# Altium project A00.IZDELIE.PrjPcb
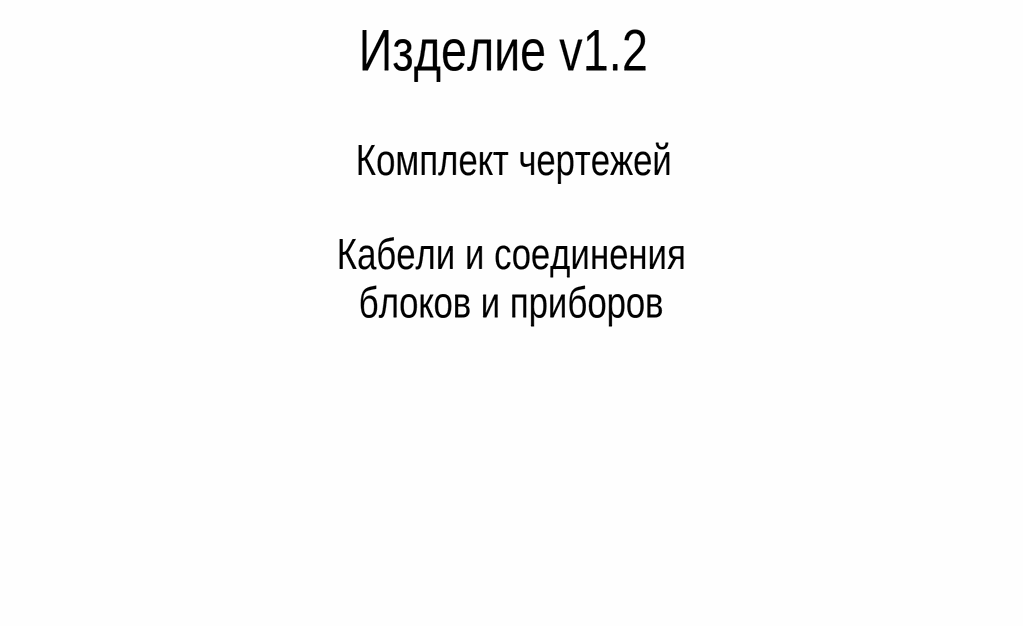
[diagram p0: 00.Izdelie.Title.SchDoc]
15 sheets, 185 parts. Net scope: global (net labels, ports and power ports of the same name join across sheets).
Sheets:
  00.Izdelie.Title.SchDoc
  01.Izdelie.Units.SchDoc
  02.C216. A01-A31,A32,A33,A34,A35,A36. Module BASU executive mechanisms.SchDoc
  02.C214. A01-A16, A17. Module BASU Stoper VN_HN.SchDoc
  02.C212. A01-A12. Module BASU Turret Horizontal aiming encoder .SchDoc
  02.C210. A01-A24. Module BASU Optics Vertical motor.SchDoc
  02.C208. A01-A22. Module BASU Optics Horizontal motor .SchDoc
  02.C207. A01-A21. Module BASU signals OPK.SchDoc
  02.C205. A01-A11. Module BASU Encoder for Horizontal motor.SchDoc
  02.C203. A01-A73. Module BASU AC power .SchDoc
  02.C108. A41-A72. Module AC220V.SchDoc
  02.C107. A41-A72. Module DC24V .SchDoc
  02.C105. A41-A02. Module Gyroscope.SchDoc
  02.C102. A41-A73. Module DC power.SchDoc
  02.C101. A41-A73. Module signals.SchDoc

## Sheet 00.Izdelie.Title.SchDoc
size 209 x 297 mm; Author: Мурашкин Д.В.; Address1: Address1; Address2: Address2; Address3: Address3; Address4: Address4; DocumentNumber: ИЗДЕЛИЕ-1-2; SheetNumber: 1; SheetTotal: 27; Scale: 1:1; Letter1Column: Э; PartName: Кабели

### Notes on the sheet
- Изделие v1.2
- Комплект чертежей
- Кабели и соединения
  блоков и приборов
- Перв. примен.
- Справ. №
- Подп. и дата
- Инв. № дубл.
- Взам. инв. №
- Разраб.
- Изм.
- Лист
- № докум.
- Подп.
- Дата
- Лит.
- Масса
- Масштаб
- Пров.
- Т.контр.
- Листов
- Инв. № подл.
- Утв.
- Н.контр.
- 2.106-A4
- Копировал
- Формат А4

## Sheet 01.Izdelie.Units.SchDoc: Электронные модули и кабели
size 209 x 297 mm; Author: Мурашкин Д.В.; Address1: Address1; Address2: Address2; Address3: Address3; Address4: Address4; DocumentNumber: ИЗДЕЛИЕ-1-2 Э6; SheetNumber: 2; Scale: 1:1; Letter1Column: Э6
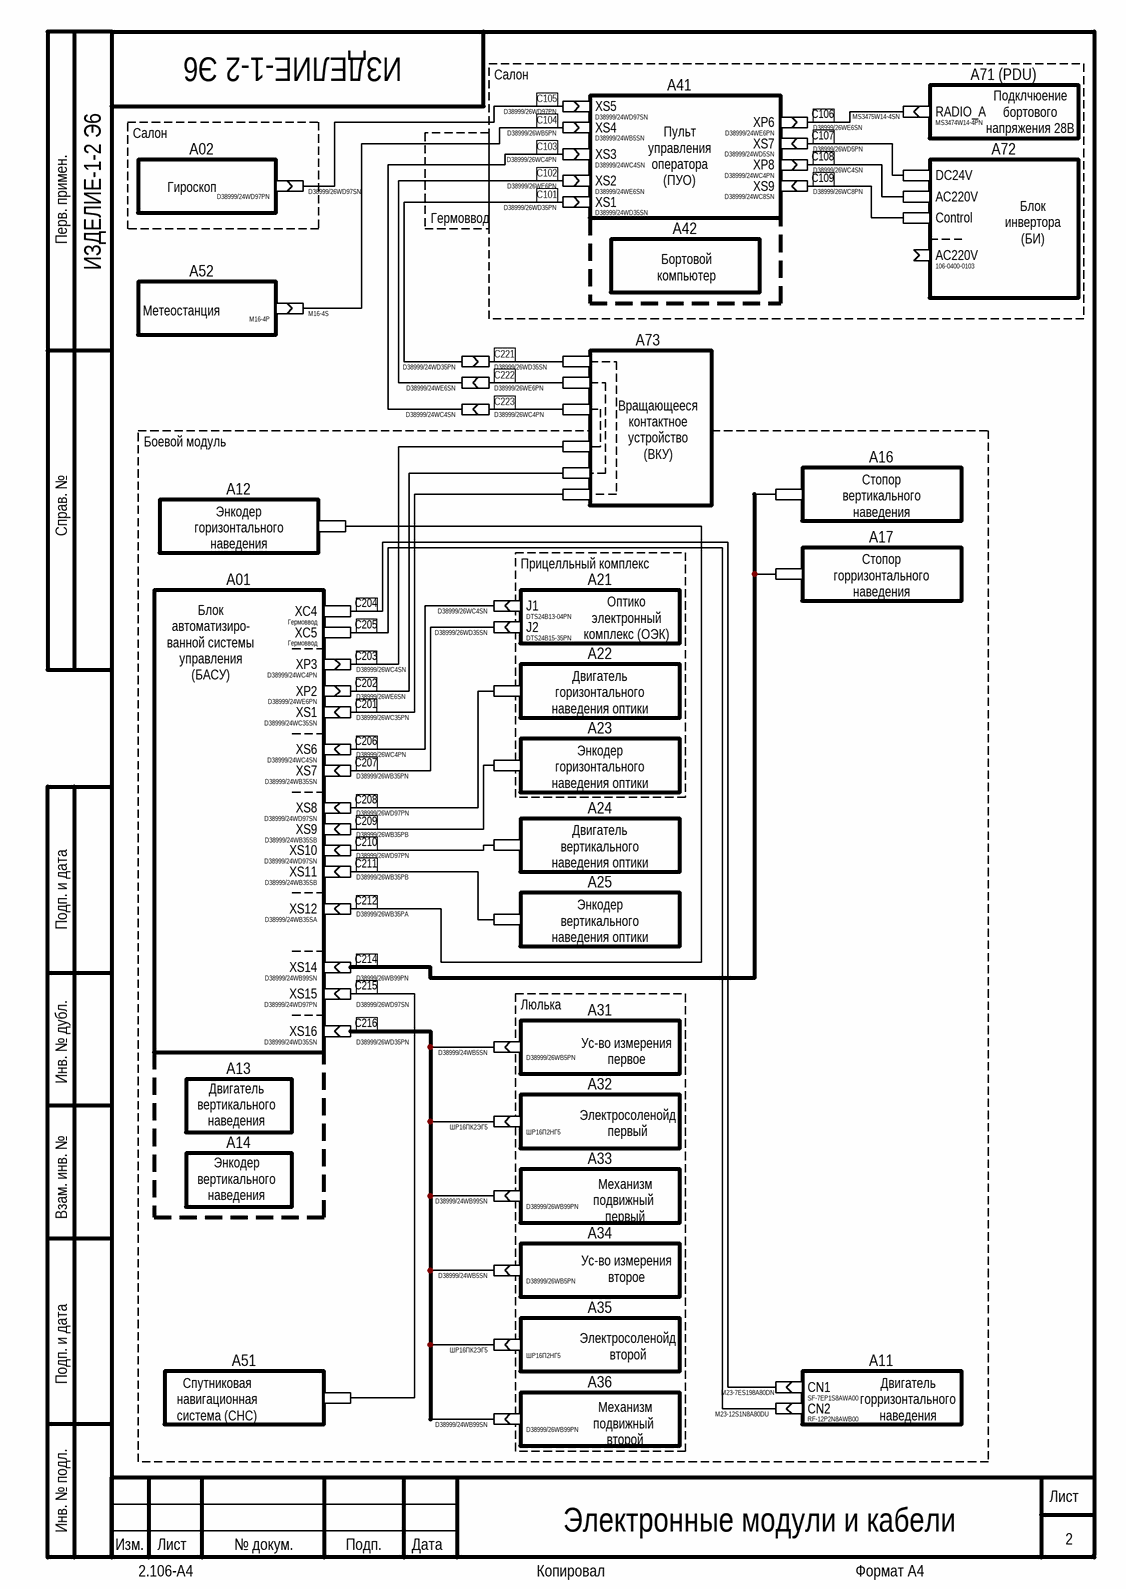
[diagram p1: 01.Izdelie.Units.SchDoc]

### Parts
(Parts that share a designator on the sheet are numbered #1, #2 ... from top to bottom, then left to right.)
A01.XP1  D38999/26WC35PN
A01.XP6  D38999/26WC4PN
A01.XP7  D38999/26WB35PN
A01.XP8  D38999/26WD97PN
A01.XP9  D38999/26WB35PB
A01.XP10  D38999/26WD97PN
A01.XP11  D38999/26WB35PB
A01.XP12  D38999/26WB35PA
A01.XP14  D38999/26WB99PN
A01.XP15  D38999/26WD97SN
A01.XP16  D38999/26WD35PN
A01.XS2  D38999/26WE6SN
A01.XS3  D38999/26WC4SN
A01.XS16.1  D38999/24WB5SN
A01.XS16.2  ШР16ПК2ЭГ5
A01.XS16.3  D38999/24WB99SN
A01.XS16.4  D38999/24WB5SN
A01.XS16.5  ШР16ПК2ЭГ5
A01.XS16.6  D38999/24WB99SN
A02.XP1  D38999/24WD97PN
A02.XS1  D38999/26WD97SN
A11.XS1  M23-7ES198A80DN  (no BOM)
A11.XS2  M23-12S1N8A80DU  (no BOM)
A12.XC1  Провод  (value not drawn)  (no BOM)
A16.XC1  Провод  (value not drawn)  (no BOM)
A17.XC1  Провод  (value not drawn)  (no BOM)
A21.XS1  D38999/26WC4SN
A21.XS2  D38999/26WD35SN
A22.XC1  Провод  (value not drawn)  (no BOM)
A23.XC1  Провод  (value not drawn)  (no BOM)
A24.XC1  Провод  (value not drawn)  (no BOM)
A25.XC1  Провод  (value not drawn)  (no BOM)
A31.XP1  D38999/26WB5PN
A32.XP1  ШР16П2НГ5  (no BOM)
A33.XP1  D38999/26WB99PN
A34.XP1  D38999/26WB5PN
A35.XP1  ШР16П2НГ5  (no BOM)
A36.XP1  D38999/26WB99PN
A41.XP1#1  D38999/26WD35PN
A41.XP2  D38999/26WE6PN
A41.XP3  D38999/26WC4PN
A41.XP4  D38999/26WB5PN
A41.XP5#1  D38999/26WD97PN
A41.XP7  D38999/26WD5PN
A41.XP9  D38999/26WC8PN
A41.XS6  D38999/26WE6SN
A41.XS8  D38999/26WC4SN
A51.XC1  (no value)  (no BOM)
A52.XP1  M16-4P  (no BOM)
A52.XS1  M16-4S  (no BOM)
A71.XS_RADIO_A  MS3475W14-4SN
A73.XC1  Провод  (value not drawn)  (no BOM)
A73.XC2  Провод  (value not drawn)  (no BOM)
A73.XC3#1  Провод  (value not drawn)  (no BOM)
A73.XC4  Провод  (value not drawn)  (no BOM)
A73.XC5  Провод  (value not drawn)  (no BOM)
A73.XC6  Провод  (value not drawn)  (no BOM)
A73.XP1#1  D38999/24WD35PN
A73.XP2#1  D38999/26WE6PN
A73.XP3  D38999/26WC4PN
A73.XS1#1  D38999/26WD35SN
A73.XS2#1  D38999/24WE6SN
A73.XS3  D38999/24WC4SN
AC220V#1  Провод  (value not drawn)  (no BOM)
AC220V#2  106-0400-0103
CN1  SF-7EP1S8AWA00  (no BOM)
CN2#1  RF-12P2N8AWB00  (no BOM)
Control  Провод  (value not drawn)  (no BOM)
DC24V  Провод  (value not drawn)  (no BOM)
J1  DTS24B13-04PN  (no BOM)
J2  DTS24B15-35PN  (no BOM)
RADIO_A  MS3474W14-4PN  (no BOM)
XC4  Гермоввод
XP2  D38999/24WE6PN
XP3  D38999/24WC4PN
XP6  D38999/24WE6PN
XP8  D38999/24WC4PN
XS1#1  D38999/24WD35SN
XS1#2  D38999/24WC35SN
XS2  D38999/24WE6SN
XS3  D38999/24WC4SN
XS4  D38999/24WB5SN
XS5  D38999/24WD97SN
XS6  D38999/24WC4SN
XS7#1  D38999/24WD5SN
XS7#2  D38999/24WB35SN
XS8  D38999/24WD97SN
XS9#1  D38999/24WC8SN
XS9#2  D38999/24WB35SB
XS10  D38999/24WD97SN
XS11  D38999/24WB35SB
XS12  D38999/24WB35SA
XS14  D38999/24WB99SN
XS15  D38999/24WD97PN
XS16  D38999/24WD35SN
XС5  Гермоввод

### Blocks framed on the sheet
A42: A41.XP1#1 A41.XP2-A41.XP4 A41.XP5#1 A41.XP7 A41.XP9 A41.XS6 A41.XS8 A71.XS_RADIO_A AC220V#1 Control DC24V XP6 XP8 XS7#1 XS9#1
A41: XS1#1 XS2-XS5
A71 (PDU): RADIO_A
A02: A02.XP1 A02.XS1
A72: AC220V#2
A21: J1 J2
A31: A31.XP1
A32: A32.XP1
A33: A33.XP1
A34: A34.XP1
A35: A35.XP1
A36: A36.XP1
A11: CN1 CN2#1

### Nets
С101: A41.XP1#1.0 A73.XP1#1.0
С102: A41.XP2.0 A73.XS2#1.0
С103: A41.XP3.0 A73.XS3.0
С104: A41.XP4.0 A52.XS1.0
С105: A02.XS1.0 A41.XP5#1.0
С106: A41.XS6.0 A71.XS_RADIO_A.0
С107: A41.XP7.0 DC24V.0
С108: A41.XS8.0 AC220V#1.0
С109: A41.XP9.0 Control.0
С201: A01.XP1.0 A73.XC6.0
С202: A01.XS2.0 A73.XC5.0
С203: A01.XS3.0 A73.XC4.0
С204: A11.XS1.0 XC4.1
С205: A11.XS2.0 XС5.1
С206: A01.XP6.0 A21.XS1.0
С207: A01.XP7.0 A21.XS2.0
С208: A01.XP8.0 A22.XC1.0
С209: A01.XP9.0 A23.XC1.0
С210: A01.XP10.0 A24.XC1.0
С211: A01.XP11.0 A25.XC1.0
С212: A01.XP12.0 A12.XC1.0
С214: A01.XP14.0 A16.XC1.0 A17.XC1.0
С215: A01.XP15.0 A51.XC1.0
С216: A01.XP16.0 A01.XS16.1.0 A01.XS16.2.0 A01.XS16.3.0 A01.XS16.4.0 A01.XS16.5.0 A01.XS16.6.0
С221: A73.XC1.0 A73.XS1#1.0
С222: A73.XC2.0 A73.XP2#1.0
С223: A73.XC3#1.0 A73.XP3.0

Not connected (* = marked no-connect by the designer): A02.XP1 0; A31.XP1 0; A32.XP1 0; A33.XP1 0; A34.XP1 0; A35.XP1 0; A36.XP1 0; A51.XC1 1; A52.XP1 0; AC220V#2 0; CN1 0; CN2#1 0; J1 0; J2 0; RADIO_A 0; XC4 0; XP2 0; XP3 0; XP6 0; XP8 0; XS1#1 0; XS1#2 0; XS2 0; XS3 0; XS4 0; XS5 0; XS6 0; XS7#1 0; XS7#2 0; XS8 0; XS9#1 0; XS9#2 0; XS10 0; XS11 0; XS12 0; XS14 0; XS15 0; XS16 0; XС5 0

### Notes on the sheet
- Салон
- (near A02.XP1) Гироскоп
- Пульт управления оператора (ПУО)
- Подклчюение бортового напряжения 28В
- Гермоввод
- Блок инвертора (БИ)
- Метеостанция
- A52
- Бортовой компьютер
- A73
- Боевой модуль
- Вращающееся контактное устройство (ВКУ)
- A16
- A12
- (near A16.XC1) Стопор вертикального наведения
- (near A12.XC1) Энкодер горизонтального наведения
- A01
- Прицелльный комплекс
- (near A17.XC1) Стопор горризонтального наведения
- A17
- Оптико электронный комплекс (ОЭК)
- A22
- Блок автоматизиро- ванной системы управления (БАСУ)
- (near A22.XC1) Двигатель горизонтального наведения оптики
- A23
- (near A23.XC1) Энкодер горизонтального наведения оптики
- (near A24.XC1) Двигатель вертикального наведения оптики
- A24
- A25
- (near A25.XC1) Энкодер вертикального наведения оптики
- Люлька
- Ус-во измерения первое
- Двигатель вертикального наведения
- A13
- Электросоленойд первый
- Энкодер вертикального наведения
- A14
- Механизм подвижный
  первый
- Ус-во измерения второе
- A51
- Электросоленойд второй
- (near A51.XC1) Спутниковая навигационная система (СНС)
- Механизм подвижный
  второй
- Двигатель горризонтального наведения
- Перв. примен.
- Справ. №
- Подп. и дата
- Инв. № дубл.
- Взам. инв. №
- Инв. № подл.
- Изм.
- Лист
- № докум.
- Подп.
- Дата
- 2.106-A4
- Копировал
- Формат А4

### Library data of the parts
A01.XP1 A01.XP6-A01.XP12 A01.XP14-A01.XP16 A02.XP1 A31.XP1 A32.XP1 A33.XP1 A34.XP1 A35.XP1 A36.XP1 A41.XP1#1 A41.XP2-A41.XP4 A41.XP5#1 A41.XP7 A41.XP9 A52.XP1 A73.XP1#1 A73.XP2#1 A73.XP3 J1 J2 RADIO_A XP2 XP3 XP6 XP8 = Connector cable plug: Operating temperature: -°C +°C; Dimension: .0mm x .0mm; Height: .0mm
  A01.XP1: Part name: D38999/26WC35PN; Mounting type: Surface mount
  A01.XP6 A41.XP3 A73.XP3: Part name: D38999/26WC4PN; Mounting type: Surface mount
  A01.XP7: Part name: D38999/26WB35PN; Mounting type: Surface mount
  A01.XP8 A01.XP10 A41.XP5#1: Part name: D38999/26WD97PN; Mounting type: Surface mount
  A01.XP9 A01.XP11: Part name: D38999/26WB35PB; Mounting type: Surface mount
  A01.XP12: Part name: D38999/26WB35PA; Mounting type: Surface mount
  A01.XP14 A33.XP1 A36.XP1: Part name: D38999/26WB99PN; Mounting type: Surface mount
  A01.XP15: Part name: D38999/26WD97SN; Mounting type: Surface mount
  A01.XP16 A41.XP1#1: Part name: D38999/26WD35PN; Mounting type: Surface mount
  A02.XP1: Part name: D38999/24WD97PN; Mounting type: Surface mount
  A31.XP1 A34.XP1 A41.XP4: Part name: D38999/26WB5PN; Mounting type: Surface mount
  A32.XP1 A35.XP1: Part name: ШР16П2НГ5; Mounting type: Surface mount
  A41.XP2 A73.XP2#1: Part name: D38999/26WE6PN; Mounting type: Surface mount
  A41.XP7: Part name: D38999/26WD5PN; Mounting type: Surface mount
  A41.XP9: Part name: D38999/26WC8PN; Mounting type: Surface mount
  A52.XP1: Part name: M16-4P; Mounting type: Surface mount
  A73.XP1#1: Part name: D38999/24WD35PN; Mounting type: Surface mount
  J1: Part name: DTS24B13-04PN; Mounting type: Surface mount
  J2: Part name: DTS24B15-35PN; Mounting type: Surface mount
  RADIO_A: Part name: MS3474W14-4PN; Mounting type: Panel
  XP2 XP6: Part name: D38999/24WE6PN; Mounting type: Surface mount
  XP3 XP8: Part name: D38999/24WC4PN; Mounting type: Surface mount
A01.XS2 A01.XS3 A01.XS16.1-A01.XS16.6 A02.XS1 A21.XS1 A21.XS2 A41.XS6 A41.XS8 A52.XS1 A71.XS_RADIO_A A73.XS1#1 A73.XS2#1 A73.XS3 XS1#1 XS1#2 XS2-XS6 XS7#1 XS7#2 XS8 XS9#1 XS9#2 XS10-XS12 XS14-XS16 = Connector cable socket: Operating temperature: -°C +°C; Dimension: .0mm x .0mm; Height: .0mm
  A01.XS2 A41.XS6: Part name: D38999/26WE6SN; Mounting type: Surface mount
  A01.XS3 A21.XS1 A41.XS8: Part name: D38999/26WC4SN; Mounting type: Surface mount
  A01.XS16.1 A01.XS16.4 XS4: Part name: D38999/24WB5SN; Mounting type: Surface mount
  A01.XS16.2 A01.XS16.5: Part name: ШР16ПК2ЭГ5; Mounting type: Surface mount
  A01.XS16.3 A01.XS16.6 XS14: Part name: D38999/24WB99SN; Mounting type: Surface mount
  A02.XS1: Part name: D38999/26WD97SN; Mounting type: Surface mount
  A21.XS2 A73.XS1#1: Part name: D38999/26WD35SN; Mounting type: Surface mount
  A52.XS1: Part name: M16-4S; Mounting type: Surface mount
  A71.XS_RADIO_A: Part name: MS3475W14-4SN; Mounting type: Cable
  A73.XS2#1 XS2: Part name: D38999/24WE6SN; Mounting type: Surface mount
  A73.XS3 XS3 XS6: Part name: D38999/24WC4SN; Mounting type: Surface mount
  XS1#1 XS16: Part name: D38999/24WD35SN; Mounting type: Surface mount
  XS1#2: Part name: D38999/24WC35SN; Mounting type: Surface mount
  XS5 XS8 XS10: Part name: D38999/24WD97SN; Mounting type: Surface mount
  XS7#1: Part name: D38999/24WD5SN; Mounting type: Surface mount
  XS7#2: Part name: D38999/24WB35SN; Mounting type: Surface mount
  XS9#1: Part name: D38999/24WC8SN; Mounting type: Surface mount
  XS9#2 XS11: Part name: D38999/24WB35SB; Mounting type: Surface mount
  XS12: Part name: D38999/24WB35SA; Mounting type: Surface mount
  XS15: Part name: D38999/24WD97PN; Mounting type: Surface mount
A11.XS1 A11.XS2 = Connector cable socket: Manufacturer: Phoenix Contact; Operating temperature: -°C +°C; Mounting type: Cable mount; Dimension: .0mm x .0mm; Height: .0mm
  A11.XS1: Part name: M23-7ES198A80DN
  A11.XS2: Part name: M23-12S1N8A80DU
A12.XC1 A16.XC1 A17.XC1 A22.XC1 A23.XC1 A24.XC1 A25.XC1 A51.XC1 A73.XC1 A73.XC2 A73.XC3#1 A73.XC4-A73.XC6 AC220V#1 Control DC24V XC4 XС5 = Connector cable coupling: Operating temperature: -°C +°C; Mounting type: Surface mount; Dimension: .0mm x .0mm; Height: .0mm
AC220V#2 = Connector cable socket: Socet 220V 2Р+РЕ 1x16А; Manufacturer: LEZARD; Part name: 106-0400-0103; Operating temperature: -°C +°C; Mounting type: Wall mount; Dimension: .0mm x .0mm; Height: .0mm
CN1 CN2#1 = Connector cable plug: Manufacturer: Phoenix Contact; Operating temperature: -°C +°C; Mounting type: Panel mount; Dimension: .0mm x .0mm; Height: .0mm
  CN1: Part name: SF-7EP1S8AWA00
  CN2#1: Part name: RF-12P2N8AWB00

## Sheet 02.C216. A01-A31,A32,A33,A34,A35,A36. Module BASU executive mechanisms.SchDoc: Кабель исполнительных механизмов
size 209 x 297 mm; Author: Мурашкин Д.В.; Address1: Address1; Address2: Address2; Address3: Address3; Address4: Address4; DocumentNumber: ИЗДЕЛИЕ-1-2; SheetNumber: 27; Scale: 1:1; Letter1Column: Э
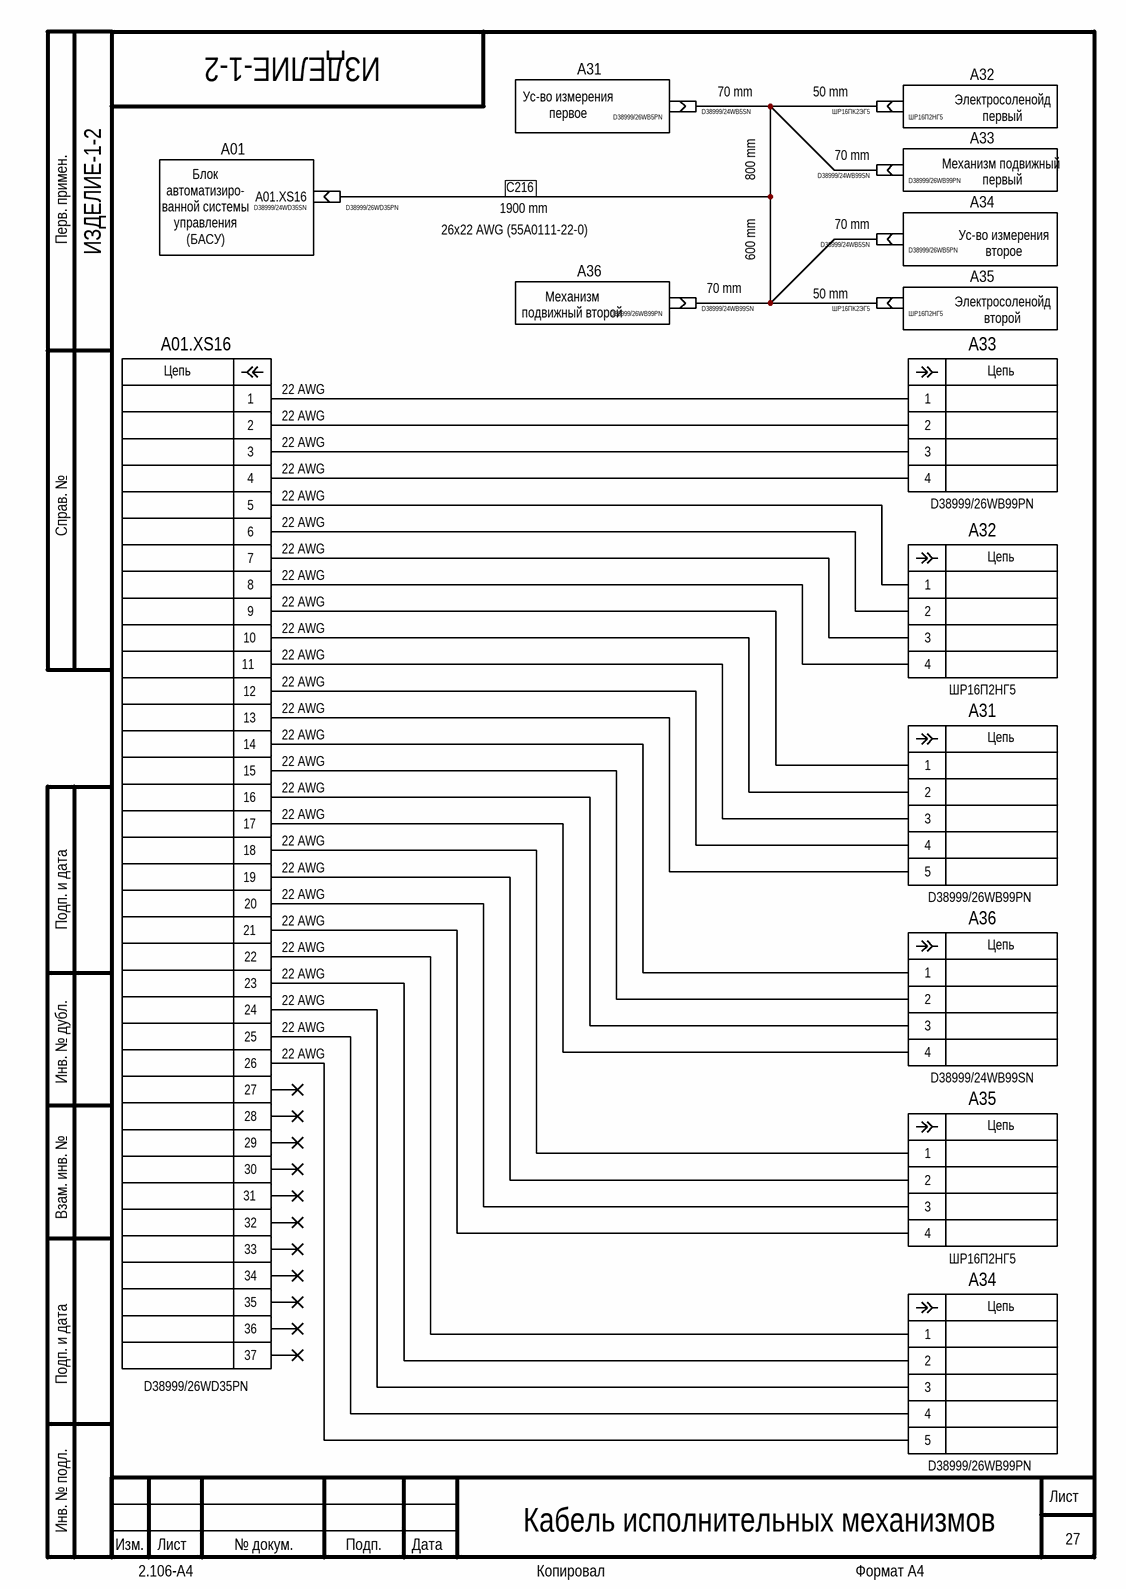
[diagram p2: 02.C216. A01-A31,A32,A33,A34,A35,A36. Module BASU executive mechanisms.SchDoc]

### Parts
(Parts that share a designator on the sheet are numbered #1, #2 ... from top to bottom, then left to right.)
A01.XS16#1  D38999/24WD35SN
A01.XS16#2  D38999/26WD35PN
A01.XS16#3  D38999/26WD35PN
A31  D38999/26WB99PN
A32  ШР16П2НГ5
A33  D38999/26WB99PN
A34  D38999/26WB99PN
A35  ШР16П2НГ5
A36  D38999/24WB99SN
A?#1  D38999/26WB5PN
A?#2  D38999/24WB5SN
A?#3  ШР16ПК2ЭГ5
A?#4  ШР16П2НГ5  (no BOM)
A?#5  D38999/24WB99SN
A?#6  D38999/26WB99PN
A?#7  D38999/24WB5SN
A?#8  D38999/26WB5PN
A?#9  D38999/26WB99PN
A?#10  D38999/24WB99SN
A?#11  ШР16ПК2ЭГ5
A?#12  ШР16П2НГ5  (no BOM)

### Blocks framed on the sheet
A32: A?#4
A33: A?#6
A34: A?#8
A35: A?#12

### Nets
С216: A01.XS16#2.0 A?#2.0 A?#3.0 A?#5.0 A?#7.0 A?#10.0 A?#11.0
NetA01.XS16#3_1: A01.XS16#3.1 A33.1
NetA01.XS16#3_2: A01.XS16#3.2 A33.2
NetA01.XS16#3_3: A01.XS16#3.3 A33.3
NetA01.XS16#3_4: A01.XS16#3.4 A33.4
NetA01.XS16#3_5: A01.XS16#3.5 A32.1
NetA01.XS16#3_6: A01.XS16#3.6 A32.2
NetA01.XS16#3_7: A01.XS16#3.7 A32.3
NetA01.XS16#3_8: A01.XS16#3.8 A32.4
NetA01.XS16#3_9: A01.XS16#3.9 A31.1
NetA01.XS16#3_10: A01.XS16#3.10 A31.2
NetA01.XS16#3_11: A01.XS16#3.11 A31.3
NetA01.XS16#3_12: A01.XS16#3.12 A31.4
NetA01.XS16#3_13: A01.XS16#3.13 A31.5
NetA01.XS16#3_14: A01.XS16#3.14 A36.1
NetA01.XS16#3_15: A01.XS16#3.15 A36.2
NetA01.XS16#3_16: A01.XS16#3.16 A36.3
NetA01.XS16#3_17: A01.XS16#3.17 A36.4
NetA01.XS16#3_18: A01.XS16#3.18 A35.1
NetA01.XS16#3_19: A01.XS16#3.19 A35.2
NetA01.XS16#3_20: A01.XS16#3.20 A35.3
NetA01.XS16#3_21: A01.XS16#3.21 A35.4
NetA01.XS16#3_22: A01.XS16#3.22 A34.1
NetA01.XS16#3_23: A01.XS16#3.23 A34.2
NetA01.XS16#3_24: A01.XS16#3.24 A34.3
NetA01.XS16#3_25: A01.XS16#3.25 A34.4
NetA01.XS16#3_26: A01.XS16#3.26 A34.5

Not connected (* = marked no-connect by the designer): A01.XS16#1 0; A01.XS16#3 27* 28* 29* 30* 31* 32* 33* 34* 35* 36* 37*; A?#1 0; A?#4 0; A?#6 0; A?#8 0; A?#9 0; A?#12 0

### Notes on the sheet
- (near A?#1) Ус-во измерения первое
- A31
- (near A?#2) 70 mm
- (near A?#3) 50 mm
- (near A?#4) Электросоленойд первый
- A01
- 800 mm
- (near A?#5) 70 mm
- (near A?#6) Механизм подвижный
  первый
- Блок автоматизиро- ванной системы управления (БАСУ)
- 26x22 AWG (55A0111-22-0)
- 1900 mm
- 600 mm
- (near A?#7) 70 mm
- (near A?#8) Ус-во измерения второе
- (near A?#9) Механизм подвижный второй
- A36
- (near A?#10) 70 mm
- (near A?#11) 50 mm
- (near A?#12) Электросоленойд второй
- (near A01.XS16#3) 22 AWG
- Перв. примен.
- Справ. №
- Подп. и дата
- Инв. № дубл.
- Взам. инв. №
- Инв. № подл.
- Изм.
- Лист
- № докум.
- Подп.
- Дата
- 2.106-A4
- Копировал
- Формат А4
- (in symbol Connector signal P5_1) Цепь
- (in symbol Connector signal P5_1_1_3) Цепь
- (in symbol Connector signal P37 MIL) Цепь

### Library data of the parts
A01.XS16#1 A?#2 A?#3 A?#5 A?#7 A?#10 A?#11 = Connector cable socket: Operating temperature: -°C +°C; Mounting type: Surface mount; Dimension: .0mm x .0mm; Height: .0mm
  A01.XS16#1: Part name: D38999/24WD35SN
  A?#2 A?#7: Part name: D38999/24WB5SN
  A?#3 A?#11: Part name: ШР16ПК2ЭГ5
  A?#5 A?#10: Part name: D38999/24WB99SN
A01.XS16#2 A?#1 A?#4 A?#6 A?#8 A?#9 A?#12 = Connector cable plug: Operating temperature: -°C +°C; Mounting type: Surface mount; Dimension: .0mm x .0mm; Height: .0mm
  A01.XS16#2: Part name: D38999/26WD35PN
  A?#1 A?#8: Part name: D38999/26WB5PN
  A?#4 A?#12: Part name: ШР16П2НГ5
  A?#6 A?#9: Part name: D38999/26WB99PN
A01.XS16#3 = Connector signal P37 MIL: P37 MIL; Operating temperature: -°C +°C; Mounting type: Surface mount; Dimension: .0mm x .0mm; Height: .0mm
A31 A34 = Connector signal P5_1: P5 MIL; Operating temperature: -°C +°C; Mounting type: Surface mount; Dimension: .0mm x .0mm; Height: .0mm
A32 A33 A35 A36 = Connector signal P5_1_1_3: P4 MIL_1; Operating temperature: -°C +°C; Mounting type: Surface mount; Dimension: .0mm x .0mm; Height: .0mm

## Sheet 02.C214. A01-A16, A17. Module BASU Stoper VN_HN.SchDoc: Кабель стопора
size 209 x 297 mm; Author: Мурашкин Д.В.; Address1: Address1; Address2: Address2; Address3: Address3; Address4: Address4; DocumentNumber: ИЗДЕЛИЕ-1-2; SheetNumber: 25; Scale: 1:1; Letter1Column: Э
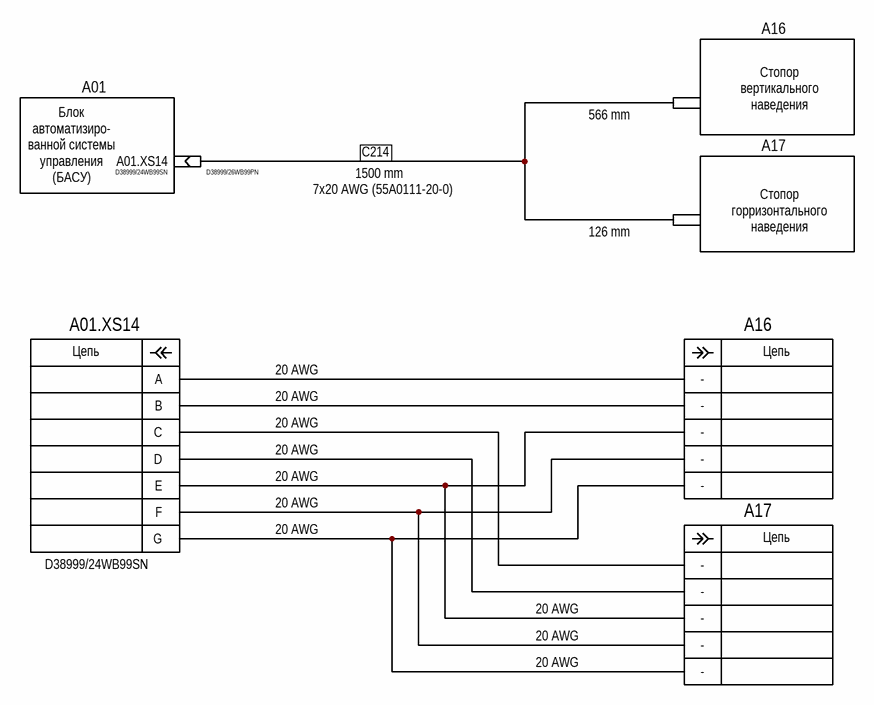
[diagram p3: 02.C214. A01-A16, A17. Module BASU Stoper VN_HN.SchDoc]

### Parts
(Parts that share a designator on the sheet are numbered #1, #2 ... from top to bottom, then left to right.)
A01.XS14#1  D38999/24WB99SN
A01.XS14#2  D38999/24WB99SN
A16  (no value)
A17  (no value)
A?#13  Провод  (value not drawn)  (no BOM)
A?#14  D38999/26WB99PN
A?#15  Провод  (value not drawn)  (no BOM)

### Nets
С214: A?#13.0 A?#14.0 A?#15.0
NetA01.XS14#2_A: A01.XS14#2.A A16.-
NetA01.XS14#2_B: A01.XS14#2.B A16.-
NetA01.XS14#2_C: A01.XS14#2.C A17.-
NetA01.XS14#2_D: A01.XS14#2.D A17.-
NetA01.XS14#2_E: A01.XS14#2.E A16.- A17.-
NetA01.XS14#2_F: A01.XS14#2.F A16.- A17.-
NetA01.XS14#2_G: A01.XS14#2.G A16.- A17.-

Not connected (* = marked no-connect by the designer): A01.XS14#1 0

### Notes on the sheet
- A01
- A16
- (near A?#13) 566 mm
- (near A?#13) Стопор вертикального наведения
- A17
- Блок автоматизиро- ванной системы управления (БАСУ)
- 7x20 AWG (55A0111-20-0)
- 1500 mm
- (near A?#15) 126 mm
- (near A?#15) Стопор горризонтального наведения
- 20 AWG
- Перв. примен.
- Справ. №
- Подп. и дата
- Инв. № дубл.
- Взам. инв. №
- Инв. № подл.
- Изм.
- Лист
- № докум.
- Подп.
- Дата
- 2.106-A4
- Копировал
- Формат А4
- (in symbol Connector signal P7) Цепь
- (in symbol P5 MIL _color) Цепь

### Library data of the parts
A01.XS14#1 = Connector cable socket: Part name: D38999/24WB99SN; Operating temperature: -°C +°C; Mounting type: Surface mount; Dimension: .0mm x .0mm; Height: .0mm
A01.XS14#2 = Connector signal P7: P7 MIL; Operating temperature: -°C +°C; Mounting type: Surface mount; Dimension: .0mm x .0mm; Height: .0mm
A16 A17 = P5 MIL _color: Operating temperature: -°C +°C; Mounting type: Surface mount; Dimension: .0mm x .0mm; Height: .0mm
A?#13 A?#15 = Connector cable coupling: Operating temperature: -°C +°C; Mounting type: Surface mount; Dimension: .0mm x .0mm; Height: .0mm
A?#14 = Connector cable plug: Part name: D38999/26WB99PN; Operating temperature: -°C +°C; Mounting type: Surface mount; Dimension: .0mm x .0mm; Height: .0mm

## Sheet 02.C212. A01-A12. Module BASU Turret Horizontal aiming encoder .SchDoc: Кабель энкодера ГН
size 209 x 297 mm; Author: Мурашкин Д.В.; Address1: Address1; Address2: Address2; Address3: Address3; Address4: Address4; DocumentNumber: ИЗДЕЛИЕ-1-2; SheetNumber: 24; Scale: 1:1; Letter1Column: Э
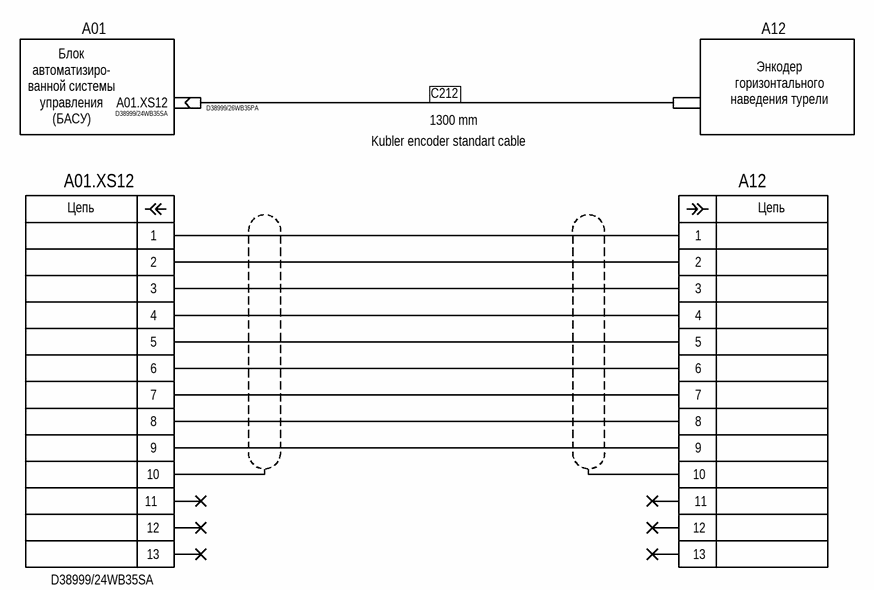
[diagram p4: 02.C212. A01-A12. Module BASU Turret Horizontal aiming encoder .SchDoc]

### Parts
(Parts that share a designator on the sheet are numbered #1, #2 ... from top to bottom, then left to right.)
A01.XS12#1  D38999/24WB35SA
A01.XS12#2  D38999/24WB35SA
A12  (no value)
A?#16  D38999/26WB35PA
A?#17  Провод  (value not drawn)  (no BOM)

### Nets
С212: A?#16.0 A?#17.0
NetA01.XS12#2_1: A01.XS12#2.1 A12.1
NetA01.XS12#2_2: A01.XS12#2.2 A12.2
NetA01.XS12#2_3: A01.XS12#2.3 A12.3
NetA01.XS12#2_4: A01.XS12#2.4 A12.4
NetA01.XS12#2_5: A01.XS12#2.5 A12.5
NetA01.XS12#2_6: A01.XS12#2.6 A12.6
NetA01.XS12#2_7: A01.XS12#2.7 A12.7
NetA01.XS12#2_8: A01.XS12#2.8 A12.8
NetA01.XS12#2_9: A01.XS12#2.9 A12.9

Not connected (* = marked no-connect by the designer): A01.XS12#1 0; A01.XS12#2 10 11* 12* 13*; A12 10 11* 12* 13*

### Notes on the sheet
- A01
- A12
- (near A?#17) Энкодер горизонтального наведения турели
- Блок автоматизиро- ванной системы управления (БАСУ)
- Kubler encoder standart cable
- 1300 mm
- Перв. примен.
- Справ. №
- Подп. и дата
- Инв. № дубл.
- Взам. инв. №
- Инв. № подл.
- Изм.
- Лист
- № докум.
- Подп.
- Дата
- 2.106-A4
- Копировал
- Формат А4
- (in symbol Connector signal P13) Цепь

### Library data of the parts
A01.XS12#1 = Connector cable socket: Part name: D38999/24WB35SA; Operating temperature: -°C +°C; Mounting type: Surface mount; Dimension: .0mm x .0mm; Height: .0mm
A01.XS12#2 A12 = Connector signal P13: P13 MIL; Operating temperature: -°C +°C; Mounting type: Surface mount; Dimension: .0mm x .0mm; Height: .0mm
A?#16 = Connector cable plug: Part name: D38999/26WB35PA; Operating temperature: -°C +°C; Mounting type: Surface mount; Dimension: .0mm x .0mm; Height: .0mm
A?#17 = Connector cable coupling: Operating temperature: -°C +°C; Mounting type: Surface mount; Dimension: .0mm x .0mm; Height: .0mm

## Sheet 02.C210. A01-A24. Module BASU Optics Vertical motor.SchDoc: Кабель двигателя ВН оптики
size 209 x 297 mm; Author: Мурашкин Д.В.; Address1: Address1; Address2: Address2; Address3: Address3; Address4: Address4; DocumentNumber: ИЗДЕЛИЕ-1-2; SheetNumber: 22; Scale: 1:1; Letter1Column: Э
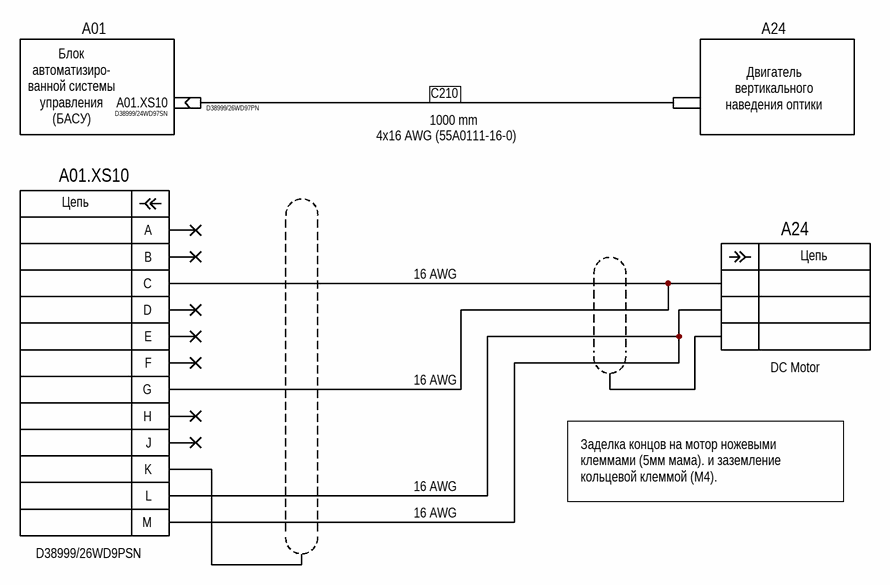
[diagram p5: 02.C210. A01-A24. Module BASU Optics Vertical motor.SchDoc]

### Parts
(Parts that share a designator on the sheet are numbered #1, #2 ... from top to bottom, then left to right.)
A01.XS10#1  D38999/24WD97SN
A01.XS10#2  D38999/26WD9PSN
A24  DC Motor
A?#18  D38999/26WD97PN
A?#19  Провод  (value not drawn)  (no BOM)

### Nets
С210: A?#18.0 A?#19.0
NetA01.XS10#2_C: A01.XS10#2.C A01.XS10#2.G A24.?2
NetA01.XS10#2_L: A01.XS10#2.L A01.XS10#2.M A24.?1

Not connected (* = marked no-connect by the designer): A01.XS10#1 0; A01.XS10#2 A* B* D* E* F* H* J* K; A24 ?3

### Notes on the sheet
- A01
- A24
- (near A?#19) Двигатель вертикального наведения оптики
- Блок автоматизиро- ванной системы управления (БАСУ)
- 4x16 AWG (55A0111-16-0)
- 1000 mm
- 16 AWG
- Заделка концов на мотор ножевыми клеммами (5мм мама). и заземление кольцевой клеммой (М4).
- Перв. примен.
- Справ. №
- Подп. и дата
- Инв. № дубл.
- Взам. инв. №
- Инв. № подл.
- Изм.
- Лист
- № докум.
- Подп.
- Дата
- 2.106-A4
- Копировал
- Формат А4
- (in symbol Connector signal P5_1_1_1) Цепь
- (in symbol Connector signal P12 MIL) Цепь

### Library data of the parts
A01.XS10#1 = Connector cable socket: Part name: D38999/24WD97SN; Operating temperature: -°C +°C; Mounting type: Surface mount; Dimension: .0mm x .0mm; Height: .0mm
A01.XS10#2 = Connector signal P12 MIL: P12 MIL; Operating temperature: -°C +°C; Mounting type: Surface mount; Dimension: .0mm x .0mm; Height: .0mm
A24 = Connector signal P5_1_1_1: Part name: DC Motor; Operating temperature: -°C +°C; Mounting type: Surface mount; Dimension: .0mm x .0mm; Height: .0mm
A?#18 = Connector cable plug: Part name: D38999/26WD97PN; Operating temperature: -°C +°C; Mounting type: Surface mount; Dimension: .0mm x .0mm; Height: .0mm
A?#19 = Connector cable coupling: Operating temperature: -°C +°C; Mounting type: Surface mount; Dimension: .0mm x .0mm; Height: .0mm

## Sheet 02.C208. A01-A22. Module BASU Optics Horizontal motor .SchDoc: Кабель двигателя ГН оптики
size 209 x 297 mm; Author: Мурашкин Д.В.; Address1: Address1; Address2: Address2; Address3: Address3; Address4: Address4; DocumentNumber: ИЗДЕЛИЕ-1-2; SheetNumber: 20; Scale: 1:1; Letter1Column: Э
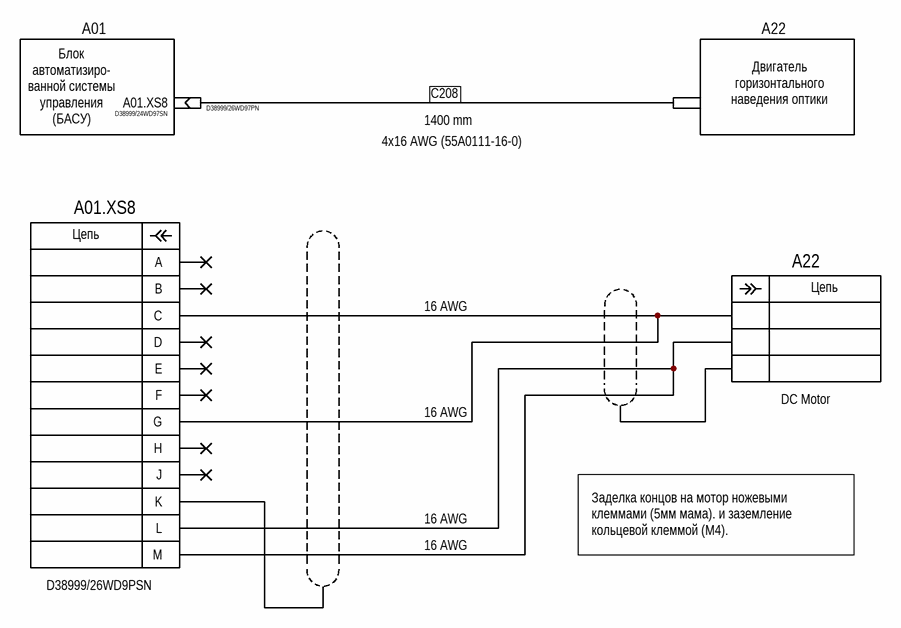
[diagram p6: 02.C208. A01-A22. Module BASU Optics Horizontal motor .SchDoc]

### Parts
(Parts that share a designator on the sheet are numbered #1, #2 ... from top to bottom, then left to right.)
A01.XS8#1  D38999/24WD97SN
A01.XS8#2  D38999/26WD9PSN
A22  DC Motor
A?#20  D38999/26WD97PN
A?#21  Провод  (value not drawn)  (no BOM)

### Nets
С208: A?#20.0 A?#21.0
NetA01.XS8#2_C: A01.XS8#2.C A01.XS8#2.G A22.?2
NetA01.XS8#2_L: A01.XS8#2.L A01.XS8#2.M A22.?1

Not connected (* = marked no-connect by the designer): A01.XS8#1 0; A01.XS8#2 A* B* D* E* F* H* J* K; A22 ?3

### Notes on the sheet
- A01
- A22
- (near A?#21) Двигатель горизонтального наведения оптики
- Блок автоматизиро- ванной системы управления (БАСУ)
- 4x16 AWG (55A0111-16-0)
- 1400 mm
- 16 AWG
- Заделка концов на мотор ножевыми клеммами (5мм мама). и заземление кольцевой клеммой (М4).
- Перв. примен.
- Справ. №
- Подп. и дата
- Инв. № дубл.
- Взам. инв. №
- Инв. № подл.
- Изм.
- Лист
- № докум.
- Подп.
- Дата
- 2.106-A4
- Копировал
- Формат А4
- (in symbol Connector signal P5_1_1_1) Цепь
- (in symbol Connector signal P12 MIL) Цепь

### Library data of the parts
A01.XS8#1 = Connector cable socket: Part name: D38999/24WD97SN; Operating temperature: -°C +°C; Mounting type: Surface mount; Dimension: .0mm x .0mm; Height: .0mm
A01.XS8#2 = Connector signal P12 MIL: P12 MIL; Operating temperature: -°C +°C; Mounting type: Surface mount; Dimension: .0mm x .0mm; Height: .0mm
A22 = Connector signal P5_1_1_1: Part name: DC Motor; Operating temperature: -°C +°C; Mounting type: Surface mount; Dimension: .0mm x .0mm; Height: .0mm
A?#20 = Connector cable plug: Part name: D38999/26WD97PN; Operating temperature: -°C +°C; Mounting type: Surface mount; Dimension: .0mm x .0mm; Height: .0mm
A?#21 = Connector cable coupling: Operating temperature: -°C +°C; Mounting type: Surface mount; Dimension: .0mm x .0mm; Height: .0mm

## Sheet 02.C207. A01-A21. Module BASU signals OPK.SchDoc: Кабель энкодера ОЭК
size 209 x 297 mm; Author: Мурашкин Д.В.; Address1: Address1; Address2: Address2; Address3: Address3; Address4: Address4; DocumentNumber: ИЗДЕЛИЕ-1-2; SheetNumber: 19; Scale: 1:1; Letter1Column: Э
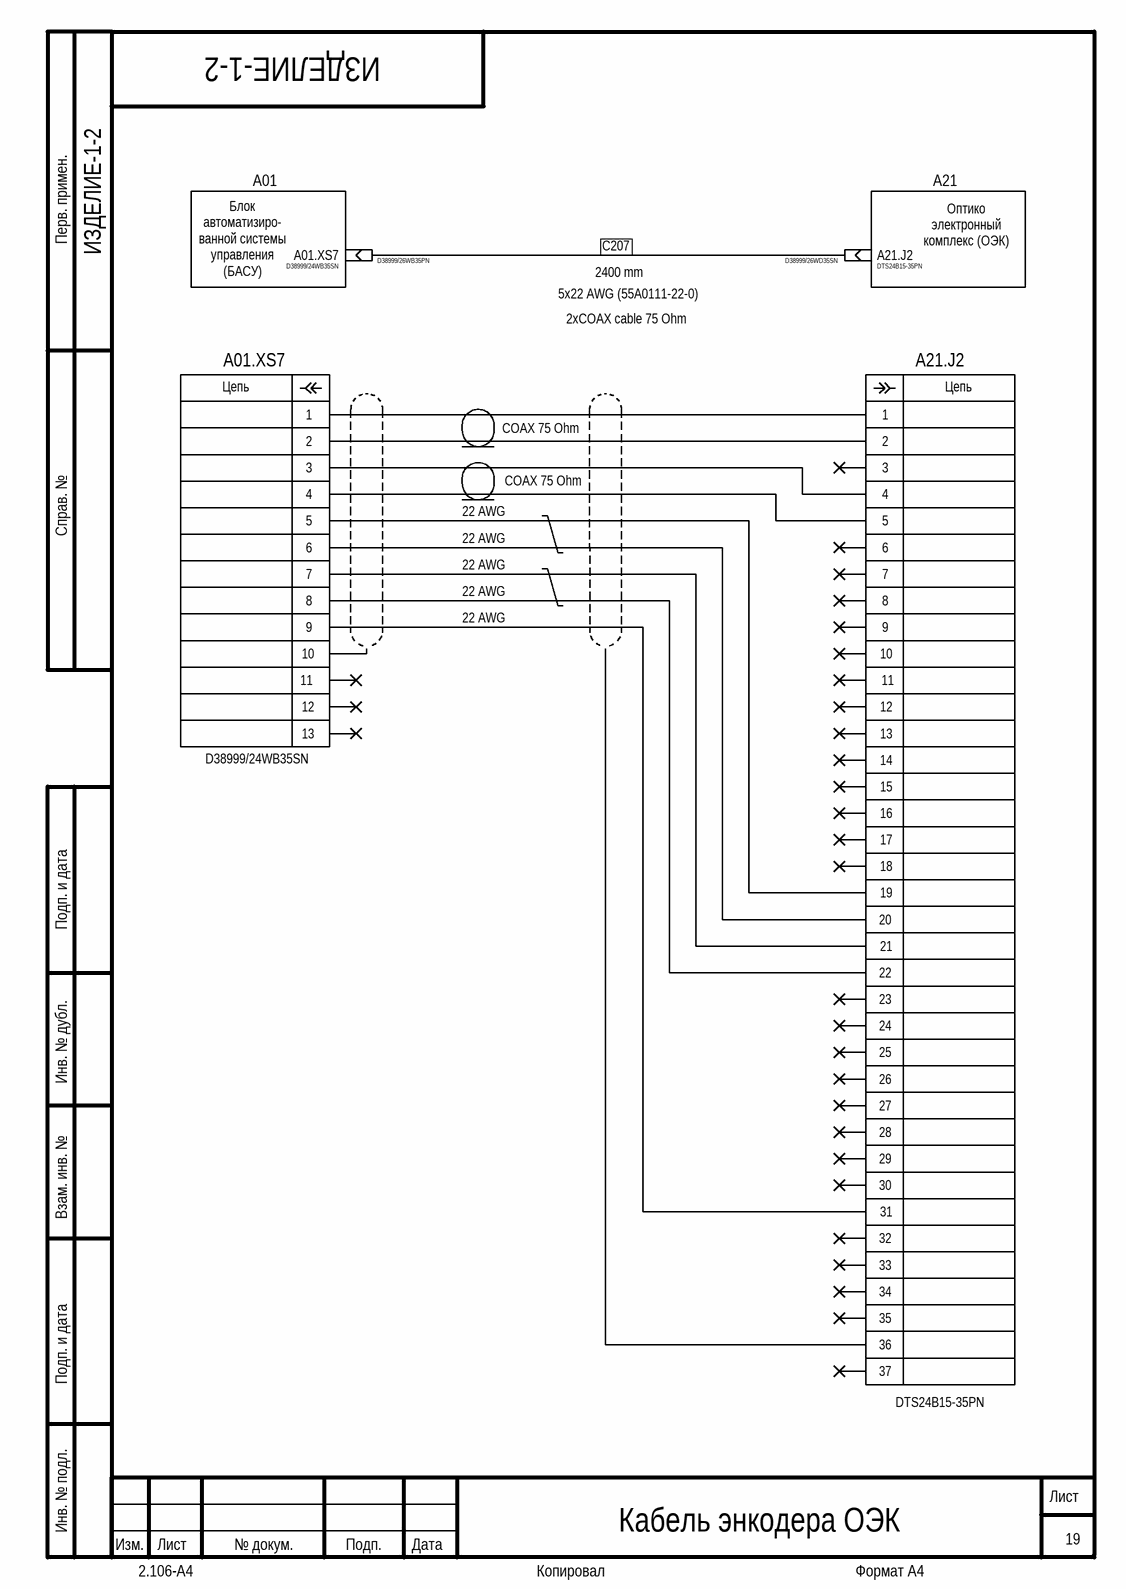
[diagram p7: 02.C207. A01-A21. Module BASU signals OPK.SchDoc]

### Parts
(Parts that share a designator on the sheet are numbered #1, #2 ... from top to bottom, then left to right.)
A01.XS7#1  D38999/24WB35SN
A01.XS7#2  D38999/24WB35SN
A21.J2#1  DTS24B15-35PN  (no BOM)
A21.J2#2  DTS24B15-35PN
A?#22  D38999/26WB35PN
A?#23  D38999/26WD35SN

### Blocks framed on the sheet
A21: A21.J2#1

### Nets
С207: A?#22.0 A?#23.0
NetA01.XS7#2_1: A01.XS7#2.1 A21.J2#2.1
NetA01.XS7#2_2: A01.XS7#2.2 A21.J2#2.2
NetA01.XS7#2_3: A01.XS7#2.3 A21.J2#2.4
NetA01.XS7#2_4: A01.XS7#2.4 A21.J2#2.5
NetA01.XS7#2_5: A01.XS7#2.5 A21.J2#2.19
NetA01.XS7#2_6: A01.XS7#2.6 A21.J2#2.20
NetA01.XS7#2_7: A01.XS7#2.7 A21.J2#2.21
NetA01.XS7#2_8: A01.XS7#2.8 A21.J2#2.22
NetA01.XS7#2_9: A01.XS7#2.9 A21.J2#2.31

Not connected (* = marked no-connect by the designer): A01.XS7#1 0; A01.XS7#2 10 11* 12* 13*; A21.J2#1 0; A21.J2#2 3* 6* 7* 8* 9* 10* 11* 12* 13* 14* 15* 16* 17* 18* 23* 24* 25* 26* 27* 28* 29* 30* 32* 33* 34* 35* 36 37*

### Notes on the sheet
- A01
- (near A21.J2#1) Оптико электронный комплекс (ОЭК)
- Блок автоматизиро- ванной системы управления (БАСУ)
- 5x22 AWG (55A0111-22-0)
- 2400 mm
- 2xCOAX cable 75 Ohm
- COAX 75 Ohm
- 22 AWG
- Перв. примен.
- Справ. №
- Подп. и дата
- Инв. № дубл.
- Взам. инв. №
- Инв. № подл.
- Изм.
- Лист
- № докум.
- Подп.
- Дата
- 2.106-A4
- Копировал
- Формат А4
- (in symbol Connector signal P13) Цепь
- (in symbol Connector signal P37 MIL) Цепь

### Library data of the parts
A01.XS7#1 A?#23 = Connector cable socket: Operating temperature: -°C +°C; Mounting type: Surface mount; Dimension: .0mm x .0mm; Height: .0mm
  A01.XS7#1: Part name: D38999/24WB35SN
  A?#23: Part name: D38999/26WD35SN
A01.XS7#2 = Connector signal P13: P13 MIL; Operating temperature: -°C +°C; Mounting type: Surface mount; Dimension: .0mm x .0mm; Height: .0mm
A21.J2#1 A?#22 = Connector cable plug: Operating temperature: -°C +°C; Mounting type: Surface mount; Dimension: .0mm x .0mm; Height: .0mm
  A21.J2#1: Part name: DTS24B15-35PN
  A?#22: Part name: D38999/26WB35PN
A21.J2#2 = Connector signal P37 MIL: P37 MIL; Operating temperature: -°C +°C; Mounting type: Surface mount; Dimension: .0mm x .0mm; Height: .0mm

## Sheet 02.C205. A01-A11. Module BASU Encoder for Horizontal motor.SchDoc: Кабель энкодера двигателя ГН
size 209 x 297 mm; Author: Мурашкин Д.В.; Address1: Address1; Address2: Address2; Address3: Address3; Address4: Address4; DocumentNumber: ИЗДЕЛИЕ-1-2; SheetNumber: 17; Scale: 1:1; Letter1Column: Э
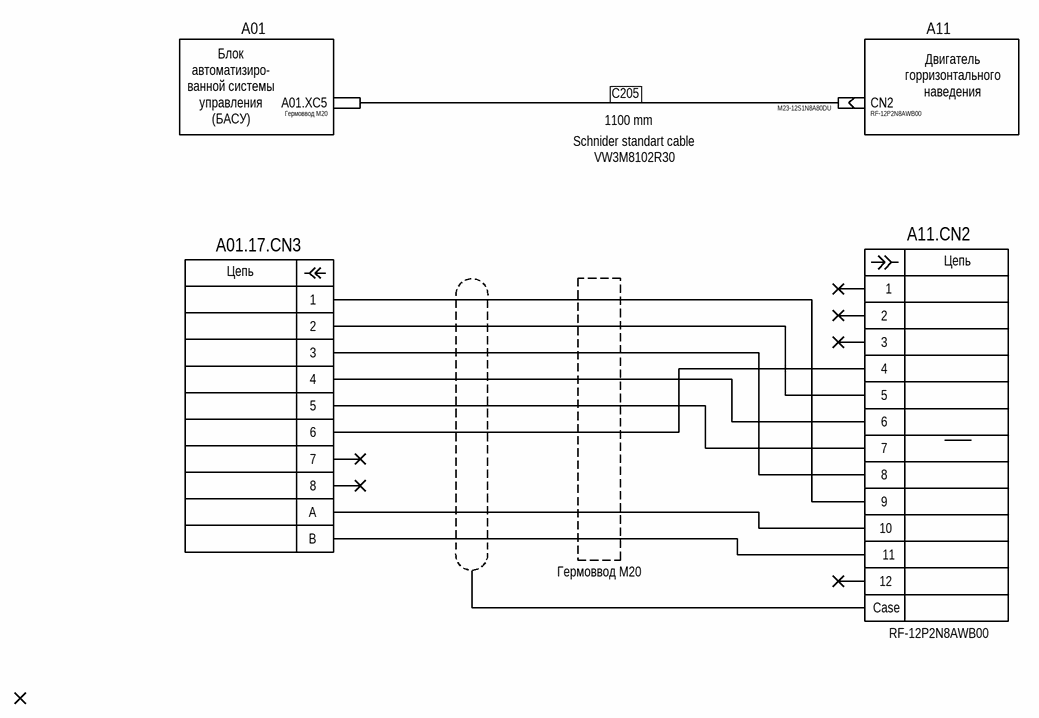
[diagram p8: 02.C205. A01-A11. Module BASU Encoder for Horizontal motor.SchDoc]

### Parts
(Parts that share a designator on the sheet are numbered #1, #2 ... from top to bottom, then left to right.)
A01.17.CN3  (no value)
A01.XC5  Гермоввод М20
A11.CN2  RF-12P2N8AWB00
A?#24  M23-12S1N8A80DU  (no BOM)
CN2#2  RF-12P2N8AWB00  (no BOM)

### Blocks framed on the sheet
A11: CN2#2

### Nets
С205: A01.XC5.1 A?#24.0
NetA01.17.CN3_1: A01.17.CN3.1 A11.CN2.9
NetA01.17.CN3_2: A01.17.CN3.2 A11.CN2.5
NetA01.17.CN3_3: A01.17.CN3.3 A11.CN2.8
NetA01.17.CN3_4: A01.17.CN3.4 A11.CN2.6
NetA01.17.CN3_5: A01.17.CN3.5 A11.CN2.7
NetA01.17.CN3_6: A01.17.CN3.6 A11.CN2.4
NetA01.17.CN3_A: A01.17.CN3.A A11.CN2.10
NetA01.17.CN3_B: A01.17.CN3.B A11.CN2.11

Not connected (* = marked no-connect by the designer): A01.17.CN3 7* 8*; A01.XC5 0; A11.CN2 1* 2* 3* 12* Case; CN2#2 0

### Notes on the sheet
- A01
- (near CN2#2) Двигатель горризонтального наведения
- Блок автоматизиро- ванной системы управления (БАСУ)
- Schnider standart cable
- VW3M8102R30
- 1100 mm
- Гермоввод М20
- Перв. примен.
- Справ. №
- Подп. и дата
- Инв. № дубл.
- Взам. инв. №
- Инв. № подл.
- Изм.
- Лист
- № докум.
- Подп.
- Дата
- 2.106-A4
- Копировал
- Формат А4
- (in symbol Connector signal P12 MIL_1_1) Цепь
- (in symbol Motor BMH0 connection CN2) Цепь

### Library data of the parts
A01.17.CN3 = Connector signal P12 MIL_1_1: P10_MIL; Operating temperature: -°C +°C; Mounting type: Surface mount; Dimension: .0mm x .0mm; Height: .0mm
A01.XC5 = Connector cable coupling: Operating temperature: -°C +°C; Mounting type: Surface mount; Dimension: .0mm x .0mm; Height: .0mm
A11.CN2 = Motor BMH0 connection CN2: Operating temperature: -°C +°C; Mounting type: Surface mount; Dimension: .0mm x .0mm; Height: .0mm
A?#24 = Connector cable socket: Manufacturer: Phoenix Contact; Part name: M23-12S1N8A80DU; Operating temperature: -°C +°C; Mounting type: Cable mount; Dimension: .0mm x .0mm; Height: .0mm
CN2#2 = Connector cable plug: Manufacturer: Phoenix Contact; Part name: RF-12P2N8AWB00; Operating temperature: -°C +°C; Mounting type: Panel mount; Dimension: .0mm x .0mm; Height: .0mm

## Sheet 02.C203. A01-A73. Module BASU AC power .SchDoc: Кабель питания 220В
size 209 x 297 mm; Author: Мурашкин Д.В.; Address1: Address1; Address2: Address2; Address3: Address3; Address4: Address4; DocumentNumber: ИЗДЕЛИЕ-1-2; SheetNumber: 15; Scale: 1:1; Letter1Column: Э
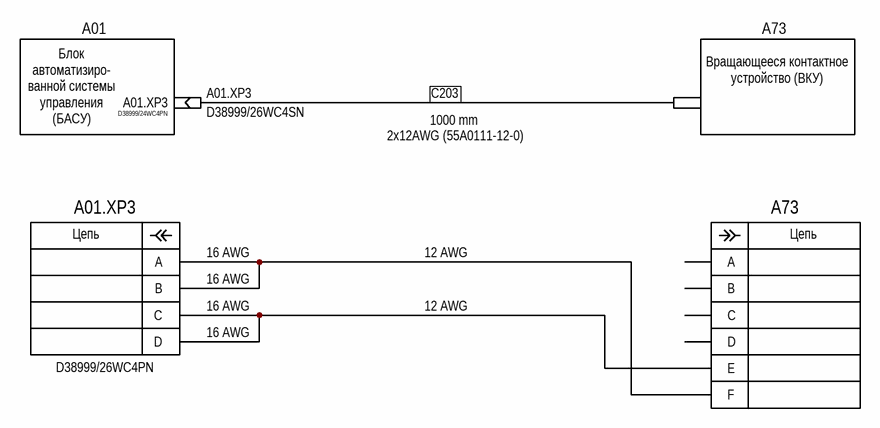
[diagram p9: 02.C203. A01-A73. Module BASU AC power .SchDoc]

### Parts
(Parts that share a designator on the sheet are numbered #1, #2 ... from top to bottom, then left to right.)
A01.XP3#1  D38999/24WC4PN
A01.XP3#2  D38999/26WC4SN
A01.XP3#3  D38999/26WC4PN
A73  (no value)
A73.XC3#2  Провод  (value not drawn)  (no BOM)

### Nets
С203: A01.XP3#2.0 A73.XC3#2.0
NetA01.XP3#3_A: A01.XP3#3.A A01.XP3#3.B A73.F
NetA01.XP3#3_C: A01.XP3#3.C A01.XP3#3.D A73.E

Not connected (* = marked no-connect by the designer): A01.XP3#1 0; A73 A B C D

### Notes on the sheet
- A01
- A73
- (near A73.XC3#2) Вращающееся контактное устройство (ВКУ)
- Блок автоматизиро- ванной системы управления (БАСУ)
- 2x12AWG (55A0111-12-0)
- 1000 mm
- (near A01.XP3#3) 16 AWG
- 12 AWG
- Перв. примен.
- Справ. №
- Подп. и дата
- Инв. № дубл.
- Взам. инв. №
- Инв. № подл.
- Изм.
- Лист
- № докум.
- Подп.
- Дата
- 2.106-A4
- Копировал
- Формат А4
- (in symbol Connector signal P5_1) Цепь
- (in symbol Connector signal P6) Цепь

### Library data of the parts
A01.XP3#1 = Connector cable socket: Operating temperature: -°C +°C; Mounting type: Surface mount; Dimension: .0mm x .0mm; Height: .0mm
A01.XP3#2 = Connector cable plug: Operating temperature: -°C +°C; Mounting type: Surface mount; Dimension: .0mm x .0mm; Height: .0mm
A01.XP3#3 = Connector signal P5_1: P4 MIL; Operating temperature: -°C +°C; Mounting type: Surface mount; Dimension: .0mm x .0mm; Height: .0mm
A73 = Connector signal P6: P6 MIL; Operating temperature: -°C +°C; Mounting type: Surface mount; Dimension: .0mm x .0mm; Height: .0mm
A73.XC3#2 = Connector cable coupling: Operating temperature: -°C +°C; Mounting type: Surface mount; Dimension: .0mm x .0mm; Height: .0mm

## Sheet 02.C108. A41-A72. Module AC220V.SchDoc: Кабель блока инвертора 220В
size 209 x 297 mm; Author: Мурашкин Д.В.; Address1: Address1; Address2: Address2; Address3: Address3; Address4: Address4; DocumentNumber: ИЗДЕЛИЕ-1-2; SheetNumber: 10; Scale: 1:1; Letter1Column: Э
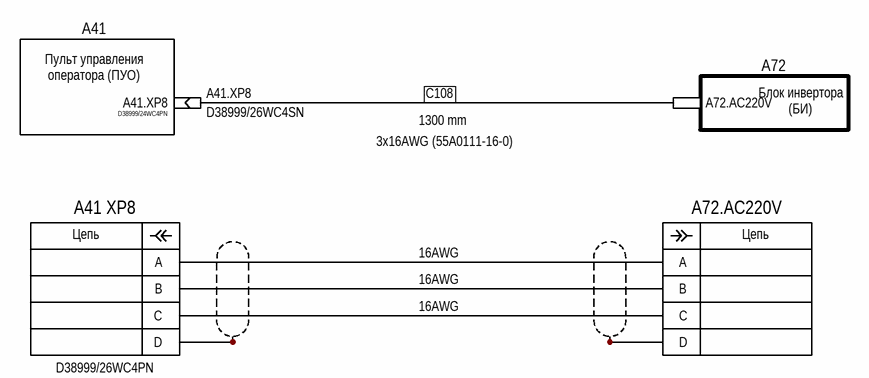
[diagram p10: 02.C108. A41-A72. Module AC220V.SchDoc]

### Parts
(Parts that share a designator on the sheet are numbered #1, #2 ... from top to bottom, then left to right.)
A41.XP8#1  D38999/24WC4PN
A41.XP8#2  D38999/26WC4SN
A41_XP8  D38999/26WC4PN
A72.AC220V#1  Провод  (value not drawn)  (no BOM)
A72.AC220V#2  (no value)

### Nets
С108: A41.XP8#2.0 A72.AC220V#1.0
NetA41_XP8_A: A41_XP8.A A72.AC220V#2.A
NetA41_XP8_B: A41_XP8.B A72.AC220V#2.B
NetA41_XP8_C: A41_XP8.C A72.AC220V#2.C

Not connected (* = marked no-connect by the designer): A41.XP8#1 0; A41_XP8 D; A72.AC220V#2 D

### Notes on the sheet
- A41
- (near A41.XP8#1) Пульт управления оператора (ПУО)
- A72
- 3x16AWG (55A0111-16-0)
- 1300 mm
- (near A72.AC220V#1) Блок инвертора (БИ)
- 16AWG
- Перв. примен.
- Справ. №
- Подп. и дата
- Инв. № дубл.
- Взам. инв. №
- Инв. № подл.
- Изм.
- Лист
- № докум.
- Подп.
- Дата
- 2.106-A4
- Копировал
- Формат А4
- (in symbol Connector signal P5_1) Цепь

### Library data of the parts
A41.XP8#1 = Connector cable socket: Operating temperature: -°C +°C; Mounting type: Surface mount; Dimension: .0mm x .0mm; Height: .0mm
A41.XP8#2 = Connector cable plug: Part name: D38999/26WD97PN; Operating temperature: -°C +°C; Mounting type: Surface mount; Dimension: .0mm x .0mm; Height: .0mm
A41_XP8 A72.AC220V#2 = Connector signal P5_1: P4 MIL; Operating temperature: -°C +°C; Mounting type: Surface mount; Dimension: .0mm x .0mm; Height: .0mm
A72.AC220V#1 = Connector cable coupling: Operating temperature: -°C +°C; Mounting type: Surface mount; Dimension: .0mm x .0mm; Height: .0mm

## Sheet 02.C107. A41-A72. Module DC24V .SchDoc: Кабель блока инвертора 24В
size 209 x 297 mm; Author: Мурашкин Д.В.; Address1: Address1; Address2: Address2; Address3: Address3; Address4: Address4; DocumentNumber: ИЗДЕЛИЕ-1-2; SheetNumber: 9; Scale: 1:1; Letter1Column: Э
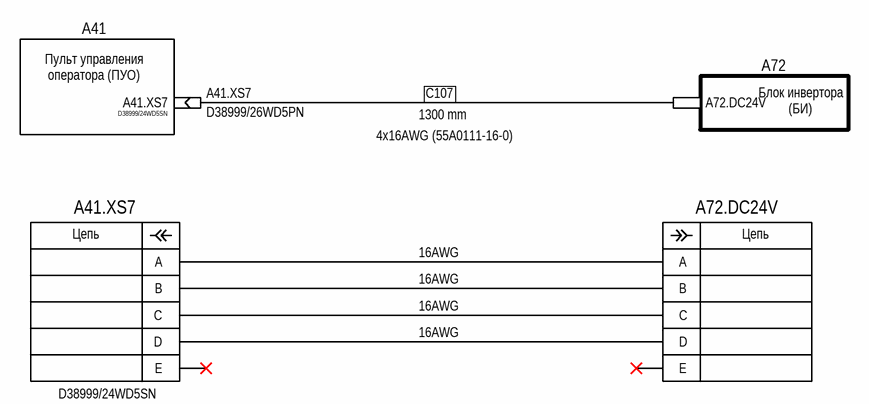
[diagram p11: 02.C107. A41-A72. Module DC24V .SchDoc]

### Parts
(Parts that share a designator on the sheet are numbered #1, #2 ... from top to bottom, then left to right.)
A41.XS7#1  D38999/24WD5SN
A41.XS7#2  D38999/26WD5PN
A41.XS7#3  D38999/24WD5SN
A72.DC24V#1  Провод  (value not drawn)  (no BOM)
A72.DC24V#2  (no value)

### Nets
С107: A41.XS7#2.0 A72.DC24V#1.0
NetA41.XS7#3_A: A41.XS7#3.A A72.DC24V#2.A
NetA41.XS7#3_B: A41.XS7#3.B A72.DC24V#2.B
NetA41.XS7#3_C: A41.XS7#3.C A72.DC24V#2.C
NetA41.XS7#3_D: A41.XS7#3.D A72.DC24V#2.D

Not connected (* = marked no-connect by the designer): A41.XS7#1 0; A41.XS7#3 E*; A72.DC24V#2 E*

### Notes on the sheet
- A41
- (near A41.XS7#1) Пульт управления оператора (ПУО)
- A72
- 4x16AWG (55A0111-16-0)
- 1300 mm
- (near A72.DC24V#1) Блок инвертора (БИ)
- 16AWG
- Перв. примен.
- Справ. №
- Подп. и дата
- Инв. № дубл.
- Взам. инв. №
- Инв. № подл.
- Изм.
- Лист
- № докум.
- Подп.
- Дата
- 2.106-A4
- Копировал
- Формат А4
- (in symbol Connector signal P5) Цепь

### Library data of the parts
A41.XS7#1 = Connector cable socket: Operating temperature: -°C +°C; Mounting type: Surface mount; Dimension: .0mm x .0mm; Height: .0mm
A41.XS7#2 = Connector cable plug: Part name: D38999/26WD97PN; Operating temperature: -°C +°C; Mounting type: Surface mount; Dimension: .0mm x .0mm; Height: .0mm
A41.XS7#3 A72.DC24V#2 = Connector signal P5: P5 MIL; Operating temperature: -°C +°C; Mounting type: Surface mount; Dimension: .0mm x .0mm; Height: .0mm
A72.DC24V#1 = Connector cable coupling: Operating temperature: -°C +°C; Mounting type: Surface mount; Dimension: .0mm x .0mm; Height: .0mm

## Sheet 02.C105. A41-A02. Module Gyroscope.SchDoc: Кабель гироскопа
size 209 x 297 mm; Author: Мурашкин Д.В.; Address1: Address1; Address2: Address2; Address3: Address3; Address4: Address4; DocumentNumber: ИЗДЕЛИЕ-1-2; SheetNumber: 7; Scale: 1:1; Letter1Column: Э
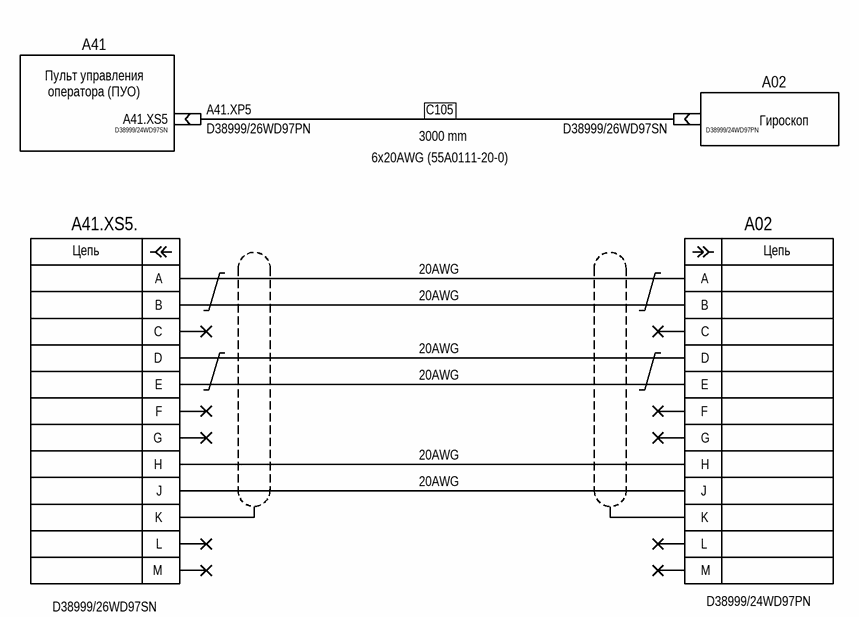
[diagram p12: 02.C105. A41-A02. Module Gyroscope.SchDoc]

### Parts
(Parts that share a designator on the sheet are numbered #1, #2 ... from top to bottom, then left to right.)
A02  D38999/24WD97PN
A41.XP5#2  D38999/26WD97PN
A41.XS5  D38999/24WD97SN
A41.XS5.  D38999/26WD97SN
A?#25  D38999/26WD97SN
A?#26  D38999/24WD97PN

### Blocks framed on the sheet
A02: A?#26

### Nets
С105: A41.XP5#2.0 A?#25.0
NetA02_A: A02.A A41.XS5..A
NetA02_B: A02.B A41.XS5..B
NetA02_D: A02.D A41.XS5..D
NetA02_E: A02.E A41.XS5..E
NetA02_H: A02.H A41.XS5..H
NetA02_J: A02.J A41.XS5..J

Not connected (* = marked no-connect by the designer): A02 C* F* G* K L* M*; A41.XS5 0; A41.XS5. C* F* G* K L* M*; A?#26 0

### Notes on the sheet
- A41
- (near A41.XS5) Пульт управления оператора (ПУО)
- (near A?#26) Гироскоп
- 6x20AWG (55A0111-20-0)
- 3000 mm
- 20AWG
- Перв. примен.
- Справ. №
- Подп. и дата
- Инв. № дубл.
- Взам. инв. №
- Инв. № подл.
- Изм.
- Лист
- № докум.
- Подп.
- Дата
- 2.106-A4
- Копировал
- Формат А4
- (in symbol Connector signal P12 MIL) Цепь

### Library data of the parts
A02 A41.XS5. = Connector signal P12 MIL: P12 MIL; Operating temperature: -°C +°C; Mounting type: Surface mount; Dimension: .0mm x .0mm; Height: .0mm
A41.XP5#2 A?#26 = Connector cable plug: Operating temperature: -°C +°C; Mounting type: Surface mount; Dimension: .0mm x .0mm; Height: .0mm
  A41.XP5#2: Part name: D38999/26WD97PN
  A?#26: Part name: D38999/24WD97PN
A41.XS5 A?#25 = Connector cable socket: Operating temperature: -°C +°C; Mounting type: Surface mount; Dimension: .0mm x .0mm; Height: .0mm
  A?#25: Part name: D38999/26WD97SN

## Sheet 02.C102. A41-A73. Module DC power.SchDoc: Силовой кабель
size 209 x 297 mm; Author: Мурашкин Д.В.; Address1: Address1; Address2: Address2; Address3: Address3; Address4: Address4; DocumentNumber: ИЗДЕЛИЕ-1-2; SheetNumber: 4; Scale: 1:1; Letter1Column: Э
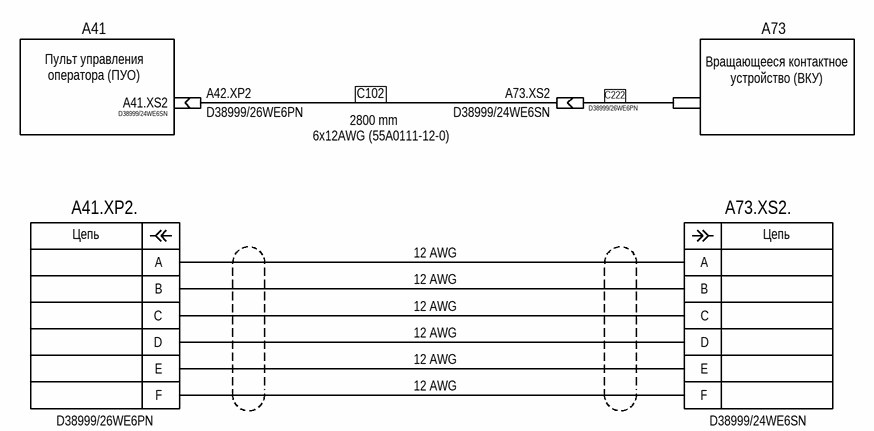
[diagram p13: 02.C102. A41-A73. Module DC power.SchDoc]

### Parts
(Parts that share a designator on the sheet are numbered #1, #2 ... from top to bottom, then left to right.)
A41.XP2.  D38999/26WE6PN
A41.XS2  D38999/24WE6SN
A42.XP2  D38999/26WE6PN
A73.XP2#2  D38999/26WE6PN
A73.XS2#2  D38999/24WE6SN
A73.XS2.  D38999/24WE6SN
A?#27  Провод  (value not drawn)  (no BOM)

### Nets
С102: A42.XP2.0 A73.XS2#2.0
С222: A73.XP2#2.0 A?#27.0
NetA41.XP2._A: A41.XP2..A A73.XS2..A
NetA41.XP2._B: A41.XP2..B A73.XS2..B
NetA41.XP2._C: A41.XP2..C A73.XS2..C
NetA41.XP2._D: A41.XP2..D A73.XS2..D
NetA41.XP2._E: A41.XP2..E A73.XS2..E
NetA41.XP2._F: A41.XP2..F A73.XS2..F

Not connected (* = marked no-connect by the designer): A41.XS2 0

### Notes on the sheet
- A41
- A73
- (near A41.XS2) Пульт управления оператора (ПУО)
- (near A?#27) Вращающееся контактное устройство (ВКУ)
- 6x12AWG (55A0111-12-0)
- 2800 mm
- 12 AWG
- Перв. примен.
- Справ. №
- Подп. и дата
- Инв. № дубл.
- Взам. инв. №
- Инв. № подл.
- Изм.
- Лист
- № докум.
- Подп.
- Дата
- 2.106-A4
- Копировал
- Формат А4
- (in symbol Connector signal P6) Цепь

### Library data of the parts
A41.XP2. A73.XS2. = Connector signal P6: P6 MIL; Operating temperature: -°C +°C; Mounting type: Surface mount; Dimension: .0mm x .0mm; Height: .0mm
  A41.XP2.: Part name: D38999/26WE6PN
  A73.XS2.: Part name: D38999/24WE6SN
A41.XS2 A73.XS2#2 = Connector cable socket: Part name: D38999/24WE6SN; Operating temperature: -°C +°C; Mounting type: Surface mount; Dimension: .0mm x .0mm; Height: .0mm
A42.XP2 A73.XP2#2 = Connector cable plug: Part name: D38999/26WE6PN; Operating temperature: -°C +°C; Mounting type: Surface mount; Dimension: .0mm x .0mm; Height: .0mm
A?#27 = Connector cable coupling: Operating temperature: -°C +°C; Mounting type: Surface mount; Dimension: .0mm x .0mm; Height: .0mm

## Sheet 02.C101. A41-A73. Module signals.SchDoc: Сигнальный кабель
size 209 x 297 mm; Author: Мурашкин Д.В.; Address1: Address1; Address2: Address2; Address3: Address3; Address4: Address4; DocumentNumber: ИЗДЕЛИЕ-1-2; SheetNumber: 3; Scale: 1:1; Letter1Column: Э
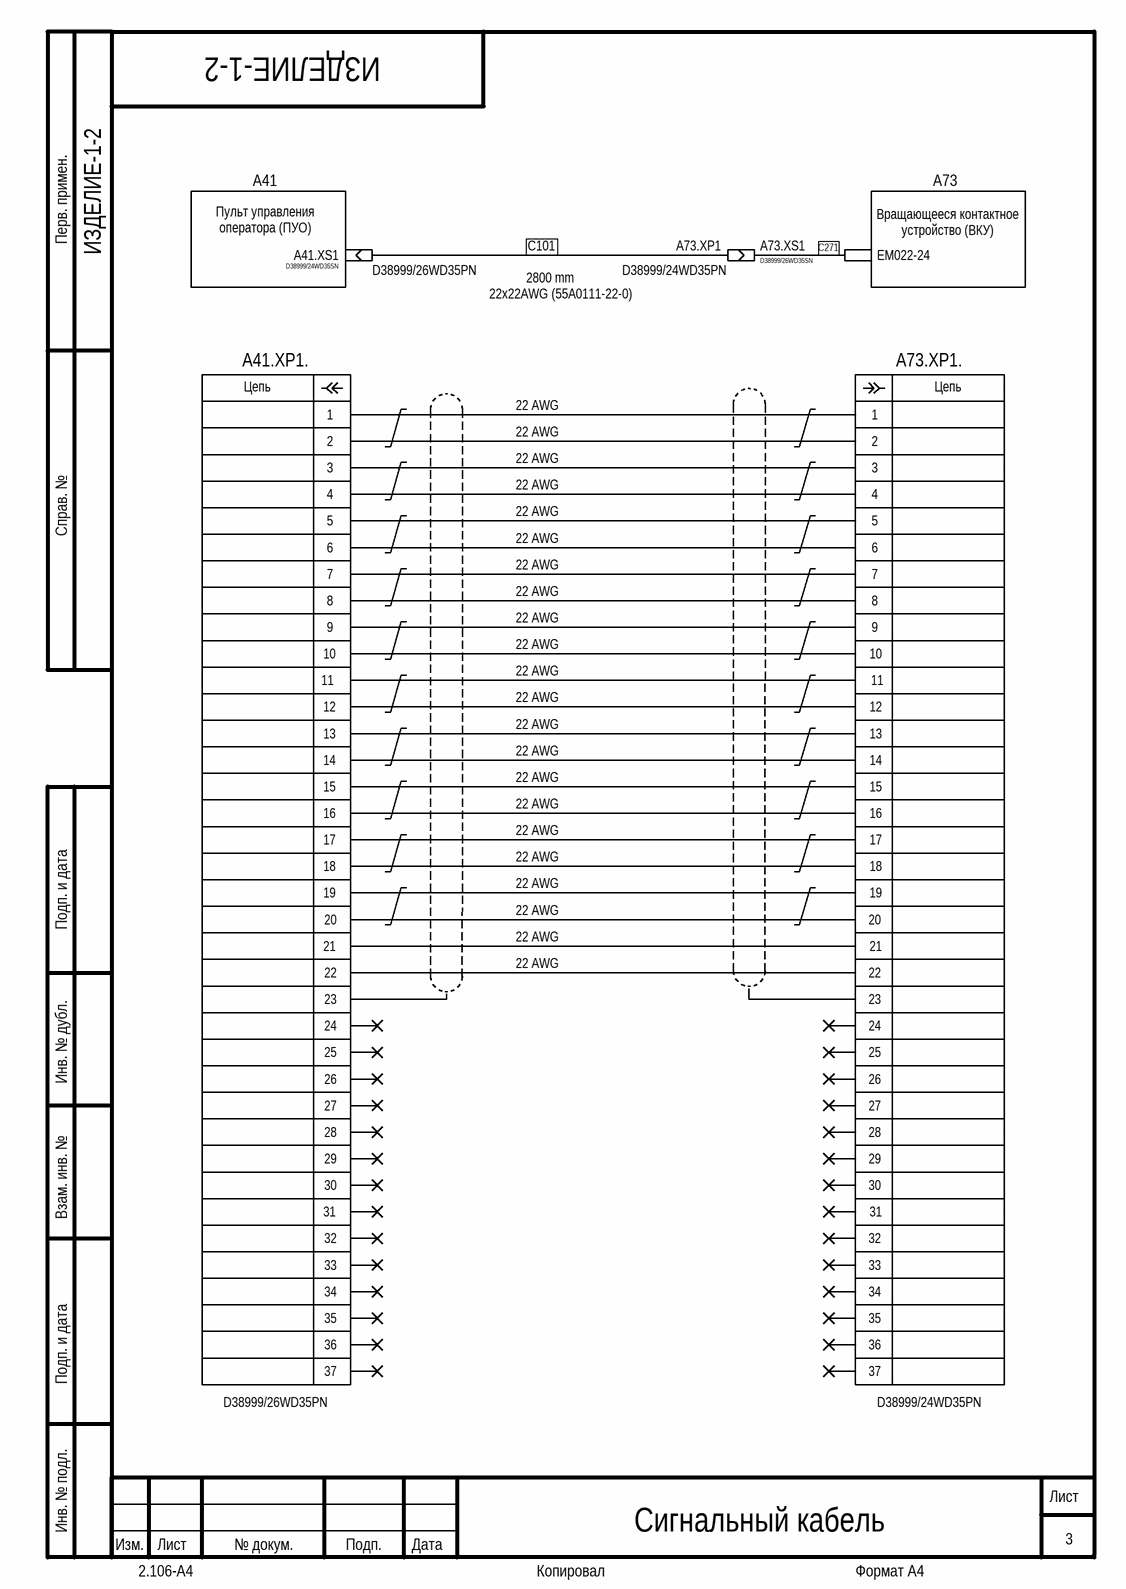
[diagram p14: 02.C101. A41-A73. Module signals.SchDoc]

### Parts
(Parts that share a designator on the sheet are numbered #1, #2 ... from top to bottom, then left to right.)
A41.XP1#2  D38999/26WD35PN
A41.XP1.  D38999/26WD35PN
A41.XS1  D38999/24WD35SN
A73.XP1#2  D38999/24WD35PN
A73.XP1.  D38999/24WD35PN
A73.XS1#2  D38999/26WD35SN
EM022-24  Провод  (value not drawn)  (no BOM)

### Nets
С101: A41.XP1#2.0 A73.XP1#2.0
С271: A73.XS1#2.0 EM022-24.0
NetA41.XP1._1: A41.XP1..1 A73.XP1..1
NetA41.XP1._2: A41.XP1..2 A73.XP1..2
NetA41.XP1._3: A41.XP1..3 A73.XP1..3
NetA41.XP1._4: A41.XP1..4 A73.XP1..4
NetA41.XP1._5: A41.XP1..5 A73.XP1..5
NetA41.XP1._6: A41.XP1..6 A73.XP1..6
NetA41.XP1._7: A41.XP1..7 A73.XP1..7
NetA41.XP1._8: A41.XP1..8 A73.XP1..8
NetA41.XP1._9: A41.XP1..9 A73.XP1..9
NetA41.XP1._10: A41.XP1..10 A73.XP1..10
NetA41.XP1._11: A41.XP1..11 A73.XP1..11
NetA41.XP1._12: A41.XP1..12 A73.XP1..12
NetA41.XP1._13: A41.XP1..13 A73.XP1..13
NetA41.XP1._14: A41.XP1..14 A73.XP1..14
NetA41.XP1._15: A41.XP1..15 A73.XP1..15
NetA41.XP1._16: A41.XP1..16 A73.XP1..16
NetA41.XP1._17: A41.XP1..17 A73.XP1..17
NetA41.XP1._18: A41.XP1..18 A73.XP1..18
NetA41.XP1._19: A41.XP1..19 A73.XP1..19
NetA41.XP1._20: A41.XP1..20 A73.XP1..20
NetA41.XP1._21: A41.XP1..21 A73.XP1..21
NetA41.XP1._22: A41.XP1..22 A73.XP1..22

Not connected (* = marked no-connect by the designer): A41.XP1. 23 24* 25* 26* 27* 28* 29* 30* 31* 32* 33* 34* 35* 36* 37*; A41.XS1 0; A73.XP1. 23 24* 25* 26* 27* 28* 29* 30* 31* 32* 33* 34* 35* 36* 37*

### Notes on the sheet
- A41
- A73
- (near A41.XS1) Пульт управления оператора (ПУО)
- (near EM022-24) Вращающееся контактное устройство (ВКУ)
- 22x22AWG (55A0111-22-0)
- 2800 mm
- 22 AWG
- Перв. примен.
- Справ. №
- Подп. и дата
- Инв. № дубл.
- Взам. инв. №
- Инв. № подл.
- Изм.
- Лист
- № докум.
- Подп.
- Дата
- 2.106-A4
- Копировал
- Формат А4
- (in symbol Connector signal P37 MIL) Цепь

### Library data of the parts
A41.XP1#2 A73.XP1#2 = Connector cable plug: Operating temperature: -°C +°C; Mounting type: Surface mount; Dimension: .0mm x .0mm; Height: .0mm
  A41.XP1#2: Part name: D38999/26WD35PN
  A73.XP1#2: Part name: D38999/24WD35PN
A41.XP1. A73.XP1. = Connector signal P37 MIL: P37 MIL; Operating temperature: -°C +°C; Mounting type: Surface mount; Dimension: .0mm x .0mm; Height: .0mm
  A41.XP1.: Part name: D38999/26WD35PN
  A73.XP1.: Part name: D38999/24WD35PN
A41.XS1 A73.XS1#2 = Connector cable socket: Operating temperature: -°C +°C; Mounting type: Surface mount; Dimension: .0mm x .0mm; Height: .0mm
  A41.XS1: Part name: D38999/24WD35SN
  A73.XS1#2: Part name: D38999/26WD35SN
EM022-24 = Connector cable coupling: Operating temperature: -°C +°C; Mounting type: Surface mount; Dimension: .0mm x .0mm; Height: .0mm

## Nets that join several sheets
С101: 01.Izdelie.Units (A41.XP1#1.0 A73.XP1#1.0), 02.C101. A41-A73. Module signals (A41.XP1#2.0 A73.XP1#2.0)
С102: 01.Izdelie.Units (A41.XP2.0 A73.XS2#1.0), 02.C102. A41-A73. Module DC power (A42.XP2.0 A73.XS2#2.0)
С105: 01.Izdelie.Units (A02.XS1.0 A41.XP5#1.0), 02.C105. A41-A02. Module Gyroscope (A41.XP5#2.0 A?#25.0)
С107: 01.Izdelie.Units (A41.XP7.0 DC24V.0), 02.C107. A41-A72. Module DC24V  (A41.XS7#2.0 A72.DC24V#1.0)
С108: 01.Izdelie.Units (A41.XS8.0 AC220V#1.0), 02.C108. A41-A72. Module AC220V (A41.XP8#2.0 A72.AC220V#1.0)
С203: 01.Izdelie.Units (A01.XS3.0 A73.XC4.0), 02.C203. A01-A73. Module BASU AC power  (A01.XP3#2.0 A73.XC3#2.0)
С205: 01.Izdelie.Units (A11.XS2.0 XС5.1), 02.C205. A01-A11. Module BASU Encoder for Horizontal motor (A01.XC5.1 A?#24.0)
С207: 01.Izdelie.Units (A01.XP7.0 A21.XS2.0), 02.C207. A01-A21. Module BASU signals OPK (A?#22.0 A?#23.0)
С208: 01.Izdelie.Units (A01.XP8.0 A22.XC1.0), 02.C208. A01-A22. Module BASU Optics Horizontal motor  (A?#20.0 A?#21.0)
С210: 01.Izdelie.Units (A01.XP10.0 A24.XC1.0), 02.C210. A01-A24. Module BASU Optics Vertical motor (A?#18.0 A?#19.0)
С212: 01.Izdelie.Units (A01.XP12.0 A12.XC1.0), 02.C212. A01-A12. Module BASU Turret Horizontal aiming encoder  (A?#16.0 A?#17.0)
С214: 01.Izdelie.Units (A01.XP14.0 A16.XC1.0 A17.XC1.0), 02.C214. A01-A16, A17. Module BASU Stoper VN_HN (A?#13.0 A?#14.0 A?#15.0)
С216: 01.Izdelie.Units (7 pins), 02.C216. A01-A31,A32,A33,A34,A35,A36. Module BASU executive mechanisms (7 pins)
С222: 01.Izdelie.Units (A73.XC2.0 A73.XP2#1.0), 02.C102. A41-A73. Module DC power (A73.XP2#2.0 A?#27.0)